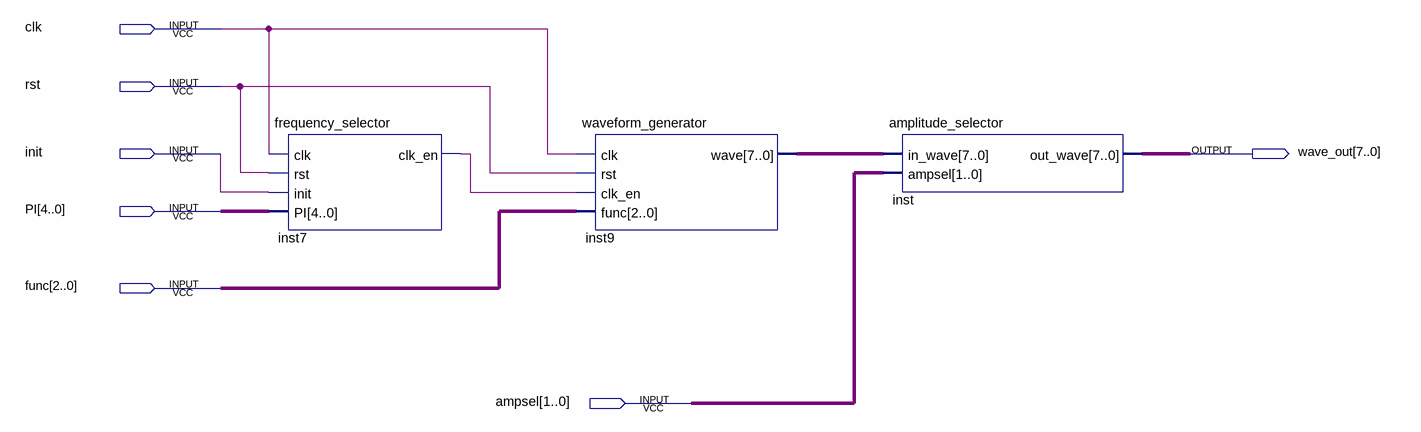
[diagram p0: schematic sheet]
// Quartus schematic function_generator_top.bdf as structural Verilog: 3 symbols, 7 pins
module function_generator_top (
  input  clk,
  input  rst,
  input  init,
  input  [4:0] PI,
  input  [2:0] func,
  input  [1:0] ampsel,
  output [7:0] wave_out
);

  wire inst7_clk_en;
  wire [7:0] inst9_wave;

  frequency_selector inst7 (.clk(clk), .rst(rst), .init(init), .PI(PI), .clk_en(inst7_clk_en));
  waveform_generator inst9 (.clk(clk), .rst(rst), .clk_en(inst7_clk_en), .func(func), .wave(inst9_wave));
  amplitude_selector inst (.in_wave(inst9_wave), .ampsel(ampsel), .out_wave(wave_out));
endmodule
